# EAGLE design fuente_buck_50v-12v_10A_v1 (EAGLE 7.6.0)
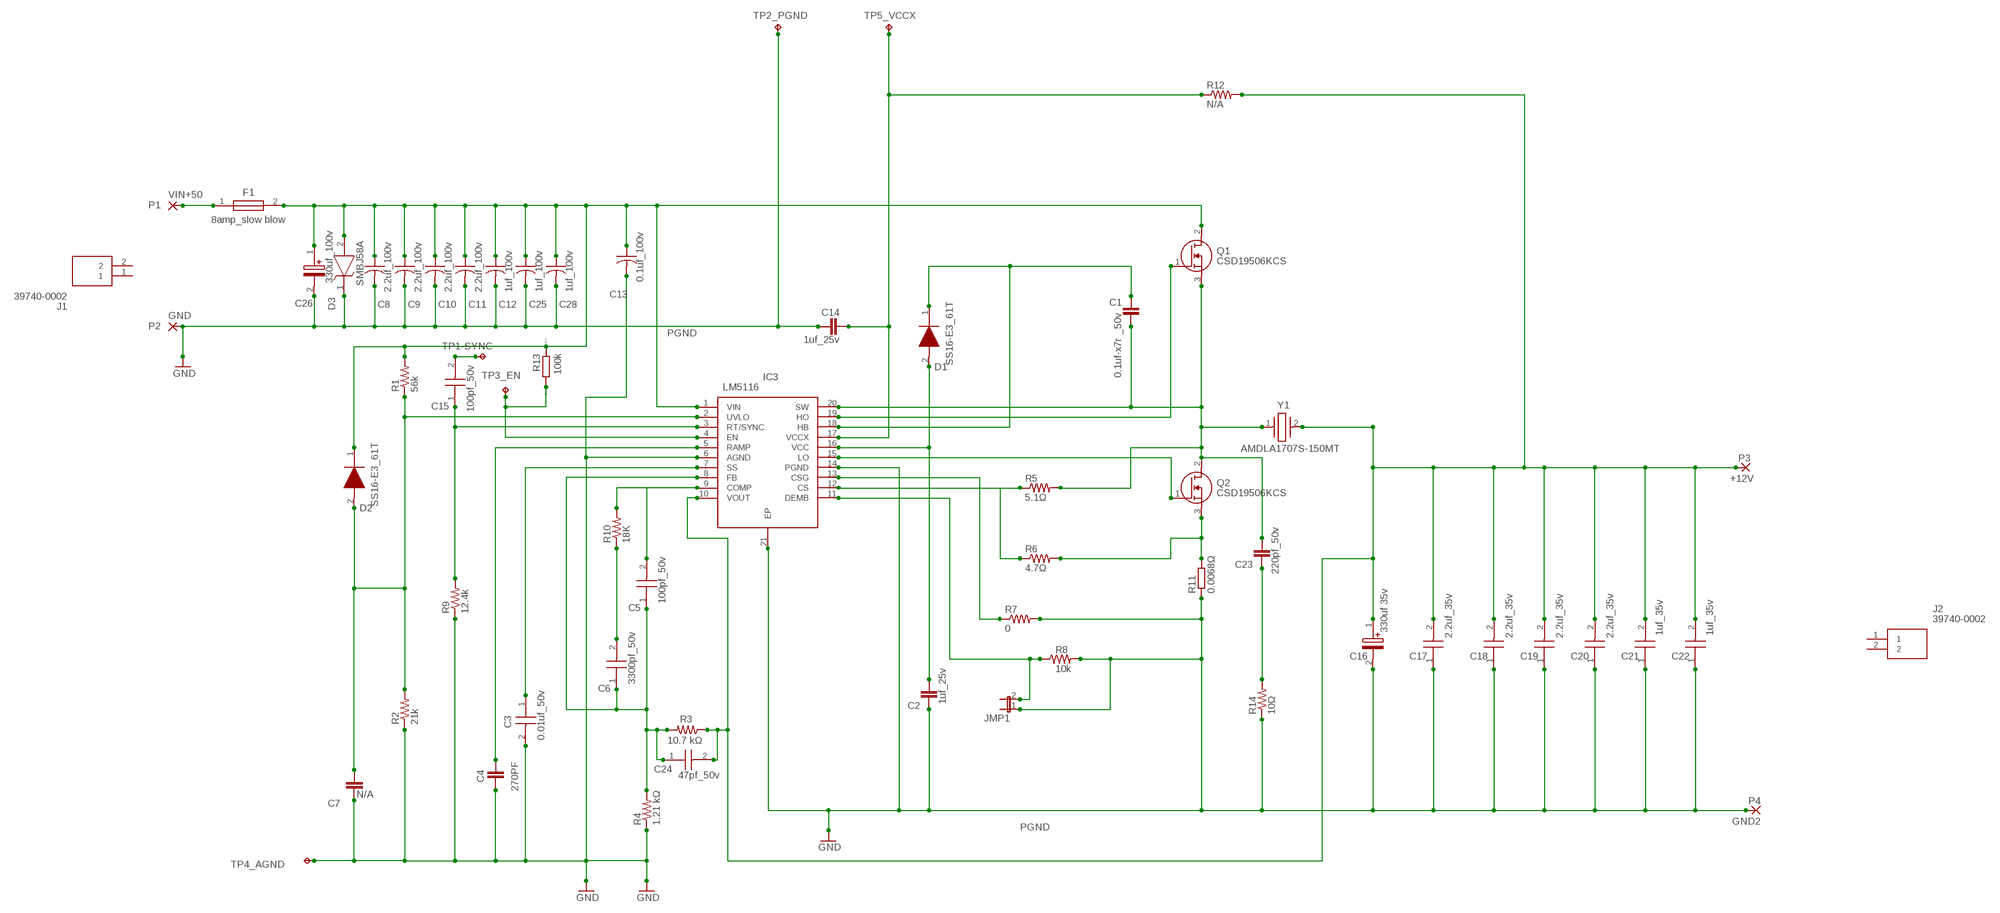
[diagram p0: schematic, sheet 1]

## Parts
+12V  P3  2,54/1,1  [2,54/1,1]
C1  0.1uf-x7r _50v  C-EUC0805  [C0805]
C2  1uf_25v  C-EUC0805  [C0805]
C3  0.01uf_50v  CGA3E2C0G1H221J080AD  [CAPC1608X90N]
C4  270PF  C-EUC0805  [C0805]
C5  100pf_50v  CGA3E2C0G1H221J080AD  [CAPC1608X90N]
C6  3300pf_50v  CGA3E2C0G1H221J080AD  [CAPC1608X90N]
C7  N/A  C-EUC0805  [C0805]
C8  2.2uf_100v  C-USC1206  [C1206]
C9  2.2uf_100v  C-USC1206  [C1206]
C10  2.2uf_100v  C-USC1206  [C1206]
C11  2.2uf_100v  C-USC1206  [C1206]
C12  1uf_100v  C-USC1206  [C1206]
C13  0.1uf_100v  C-USC1206  [C1206]
C14  1uf_25v  C-EUC0805  [C0805]
C15  100pf_50v  CGA3E2C0G1H221J080AD  [CAPC1608X90N]
C16  330uf 35v  EEEFK1V331P  [EEE0JA152UAP]
C17  2.2uf_35v  CL31B225KAHNNNE  [CAPC3216X180N]
C18  2.2uf_35v  CL31B225KAHNNNE  [CAPC3216X180N]
C19  2.2uf_35v  CL31B225KAHNNNE  [CAPC3216X180N]
C20  2.2uf_35v  CL31B225KAHNNNE  [CAPC3216X180N]
C21  1uf_35v  CL31B225KAHNNNE  [CAPC3216X180N]
C22  1uf_35v  CL31B225KAHNNNE  [CAPC3216X180N]
C23  220pf_50v  C-EUC0805  [C0805]
C24  47pf_50v  CGA3E2C0G1H221J080AD  [CAPC1608X90N]
C25  1uf_100v  C-USC1206  [C1206]
C26  330uf_100v  UCD2A331MNQ1MS  [CAPAE1910X1750N]
C28  1uf_100v  C-USC1206  [C1206]
D1  SS16-E3_61T  [DIOM5127X229N]
D2  SS16-E3_61T  [DIOM5127X229N]
D3  SMBJ58A  [DIOM5436X261N]
F1  8amp_slow blow  SF-1206S800W-2  [FUSC3216X123N]
GND  P2  2,54/1,1  [2,54/1,1]
GND2  P4  2,54/1,1  [2,54/1,1]
IC3  LM5116  LM5116MHX_NOPB  [SOP65P640X110-21N]
J1  39740-0002  [397400002]
J2  39740-0002  [397400002]
JMP1  JP1E  [JP1]
Q1  CSD19506KCS  [TO254P470X1016X1611-3P]
Q2  CSD19506KCS  [TO254P470X1016X1611-3P]
R1  56k  R-US_M0805  [M0805]
R2  21k  R-US_M0805  [M0805]
R3  10.7 kΩ  R-US_M0805  [M0805]
R4  1.21 kΩ  R-US_M0805  [M0805]
R5  5.1Ω  R-US_M0805  [M0805]
R6  4.7Ω  R-US_M0805  [M0805]
R7  0  R-US_M0805  [M0805]
R8  10k  R-US_M0805  [M0805]
R9  12.4k  R-US_M0805  [M0805]
R10  18K  R-US_M0805  [M0805]
R11  0.0068Ω  R-EU_R2512  [R2512]
R12  N/A  R-US_M0805  [M0805]
R13  100k  R  [R0805]
R14  10Ω  R-US_M0805  [M0805]
TP1-SYNC  TP1  TPPAD1-13  [P1-13]
TP2_PGND  TPPAD1-13  [P1-13]
TP3_EN  TPPAD1-13  [P1-13]
TP4_AGND  TPPAD1-13  [P1-13]
TP5_VCCX  TPPAD1-13  [P1-13]
VIN+50  P1  2,54/1,1  [2,54/1,1]
Y1  AMDLA1707S-150MT  [INDPM178169X700N]

## Nets
10K [power]: C2.1 D1.2(A) IC3.16(VCC)
GND [power]: C2.2 C3.2 C4.2 C7.2 C8.2 C9.2 C10.2 C11.2 C12.2 C13.2 C14.1 C16.2(-) C17.1 C18.1 C19.1 C20.1 C21.1 C22.1 C25.2 C26.2(-) C28.2 D3.1(K) GND2.1(P) GND.1(P) IC3.6(AGND) IC3.14(PGND) IC3.21(EP) JMP1.1 R2.1 R4.1 R7.2 R8.2 R9.1 R11.1 R14.1 TP2_PGND.TP TP4_AGND.TP
N$1: C5.1 C6.1 C24.1 IC3.8(FB) R3.2 R4.2
N$2: F1.1 VIN+50.1(P)
N$3: C23.2 R14.2
N$4: C7.1 D2.2(A) IC3.2(UVLO) R1.1 R2.2
N$5: C15.1 IC3.3(RT/SYNC) R9.2
N$6: C15.2 TP1-SYNC.TP
N$7: C4.1 IC3.5(RAMP)
N$8: C3.1 IC3.7(SS)
N$9: C14.2 IC3.17(VCCX) R12.1 TP5_VCCX.TP
N$10: C5.2 IC3.9(COMP) R10.2
N$11: IC3.19(HO) Q1.1(G)
N$12: C6.2 R10.1
N$14: +12V.1(P) C16.1(+) C17.2 C18.2 C19.2 C20.2 C21.2 C22.2 C24.2 IC3.10(VOUT) R3.1 R12.2 Y1.2
N$16: IC3.4(EN) R13.1 TP3_EN.TP
N$17: C1.1 C23.1 IC3.20(SW) Q1.3(S) Q2.2(D) R5.2 Y1.1
N$18: IC3.15(LO) Q2.1(G)
N$19: C1.2 D1.1(K) IC3.18(HB)
N$20: IC3.13(CSG) R7.1
N$21: Q2.3(S) R6.2 R11.2
N$23: IC3.11(DEMB) JMP1.2 R8.1
N$24: IC3.12(CS) R5.1 R6.1
VIN: C8.1 C9.1 C10.1 C11.1 C12.1 C13.1 C25.1 C26.1(+) C28.1 D2.1(K) D3.2(A) F1.2 IC3.1(VIN) Q1.2(D) R1.2 R13.2
Unconnected: J1.1 J1.2 J2.1 J2.2

## Notes on the sheet
- PGND
- PGND

## Library data of the parts
+12V GND GND2 VIN+50 = wirepad:2,54/1,1: THROUGH-HOLE PAD
C1 C2 C4 C7 C14 C23 = rcl:C-EU: CAPACITOR, European symbol
C3 C5 C6 C15 C24 = CGA3E2C0G1H221J080AD:CGA3E2C0G1H221J080AD: Multilayer Ceramic Capacitors MLCC - SMD/SMT EPXY 0603 50V, AEC-Q200, 220pF Source: Datasheet; DESCRIPTION: Multilayer Ceramic Capacitors MLCC - SMD/SMT EPXY 0603 50V, AEC-Q200, 220pF; HEIGHT: 0.9mm; MANUFACTURER_NAME: TDK; MANUFACTURER_PART_NUMBER: CGA3E2C0G1H221J080AD; MOUSER_PART_NUMBER: 810-CGA3E2C0G1H221JD; MOUSER_PRICE-STOCK: https://www.mouser.co.uk/ProductDetail/TDK/CGA3E2C0G1H221J080AD?qs=xLDY6iXSiQauXd%252Brvgz98g%3D%3D
C8-C13 C25 C28 = rcl:C-US: CAPACITOR, American symbol
C16 = EEEFK1V331P:EEEFK1V331P: SMD Aluminium Electrolytic Capacitor,Radial Can - SMD, 330 F, 35 V, FK Series, 2000 hours @ 105C Source: Datasheet <http://industrial.panasonic.com/cdbs/www-data/pdf/RDE0000/ABA0000C1181.pdf>; DESCRIPTION: SMD Aluminium Electrolytic Capacitor,Radial Can - SMD, 330 F, 35 V, FK Series, 2000 hours @ 105C; HEIGHT: 12mm; MANUFACTURER_NAME: Panasonic; MANUFACTURER_PART_NUMBER: EEEFK1V331P
C17-C22 = CL31B225KAHNNNE:CL31B225KAHNNNE: Samsung Electro-Mechanics 1206 CL 2.2uF Ceramic Multilayer Capacitor, 25 V, +125C, X7R Dielectric, +/-10% SMD Source: Datasheet <https://www.mouser.in/datasheet/2/585/MLCC-1837944.pdf>; DESCRIPTION: Samsung Electro-Mechanics 1206 CL 2.2uF Ceramic Multilayer Capacitor, 25 V, +125C, X7R Dielectric, +/-10% SMD; HEIGHT: 1.8mm; MANUFACTURER_NAME: SAMSUNG; MANUFACTURER_PART_NUMBER: CL31B225KAHNNNE
C26 = UCD2A331MNQ1MS:UCD2A331MNQ1MS: Nichicon 330F 100V dc Aluminium Electrolytic Capacitor, Surface Mount 18 (Dia.) x 16.5mm +105C 18mm Source: Datasheet <http://nichicon-us.com/english/products/pdfs/e-ucd.pdf>; DESCRIPTION: Nichicon 330F 100V dc Aluminium Electrolytic Capacitor, Surface Mount 18 (Dia.) x 16.5mm +105C 18mm; HEIGHT: 17.5mm; MANUFACTURER_NAME: Nichicon; MANUFACTURER_PART_NUMBER: UCD2A331MNQ1MS
D1 D2 = SS16-E3_61T:SS16-E3_61T: Vishay SS16-E3/61T, SMT Schottky Diode, 60V 1A, 2-Pin DO-214AC Source: Datasheet <https://componentsearchengine.com/Datasheets/2/SS16-E3_61T.pdf>; DESCRIPTION: Vishay SS16-E3/61T, SMT Schottky Diode, 60V 1A, 2-Pin DO-214AC; HEIGHT: 2.29mm; MANUFACTURER_NAME: Vishay; MANUFACTURER_PART_NUMBER: SS16-E3/61T; MOUSER_PART_NUMBER: 625-SS16-E3; MOUSER_PRICE-STOCK: https://www.mouser.co.uk/ProductDetail/Vishay-General-Semiconductor/SS16-E3-61T?qs=x2jpVgRnAtMiLlJLdPGu3w%3D%3D
D3 = SMBJ58A:SMBJ58A: Littelfuse SMBJ58A, Uni-Directional TVS Diode, 600W, 2-Pin DO-214AA Source: Datasheet <https://m.littelfuse.com/~/media/electronics/datasheets/tvs_diodes/littelfuse_tvs_diode_smbj_datasheet.pdf.pdf>; DESCRIPTION: Littelfuse SMBJ58A, Uni-Directional TVS Diode, 600W, 2-Pin DO-214AA; HEIGHT: 2.61mm; MANUFACTURER_NAME: LITTELFUSE; MANUFACTURER_PART_NUMBER: SMBJ58A
F1 = SF-1206S800W-2:SF-1206S800W-2: Surface Mount Fuses 8.0A Slow Blow 1206 SinglFuse Source: Datasheet <https://componentsearchengine.com/Datasheets/2/SF-1206S800W-2.pdf>; DESCRIPTION: Surface Mount Fuses 8.0A Slow Blow 1206 SinglFuse; HEIGHT: 1.23mm; MANUFACTURER_NAME: Bourns; MANUFACTURER_PART_NUMBER: SF-1206S800W-2; MOUSER_PART_NUMBER: 652-SF-1206S800W-2; MOUSER_PRICE-STOCK: https://www.mouser.co.uk/ProductDetail/Bourns/SF-1206S800W-2/?qs=fAHHVMwC%252BbhqdiwPMKxViA%3D%3D
IC3 = LM5116MHX_NOPB:LM5116MHX_NOPB: 6-100V Wide Vin, Current Mode Synchronous Buck Controller Source: Datasheet <http://www.ti.com/lit/gpn/lm5116>; DESCRIPTION: 6-100V Wide Vin, Current Mode Synchronous Buck Controller; HEIGHT: 1.1mm; MANUFACTURER_NAME: Texas Instruments; MANUFACTURER_PART_NUMBER: LM5116MHX/NOPB; MOUSER_PART_NUMBER: 926-LM5116MHX/NOPB; MOUSER_PRICE-STOCK: https://www.mouser.co.uk/ProductDetail/Texas-Instruments/LM5116MHX-NOPB?qs=QbsRYf82W3EaCl%2FW15P7yA%3D%3D
J1 J2 = 39740-0002:39740-0002: Pluggable Terminal Blocks EURO TERM BLK VERT 3.81MM 2C-GREEN Source: Datasheet <https://tools.molex.com/pdm_docs/sd/397400002_sd.pdf>; DESCRIPTION: Pluggable Terminal Blocks EURO TERM BLK VERT 3.81MM 2C-GREEN; HEIGHT: 8.9mm; MANUFACTURER_NAME: Molex; MANUFACTURER_PART_NUMBER: 39740-0002; MOUSER_PART_NUMBER: 538-39740-0002; MOUSER_PRICE-STOCK: https://www.mouser.co.uk/ProductDetail/Molex/39740-0002?qs=PVVDbbWpW3JCaIt2SPtzGA%3D%3D
JMP1 = jumper:JP1E: JUMPER
Q1 Q2 = CSD19506KCS:CSD19506KCS: Texas Instruments CSD19506KCS N-channel MOSFET Transistor, 273 A, 80 V, 3-Pin TO-220 Source: Datasheet <http://www.ti.com/lit/gpn/csd19506kcs>; DESCRIPTION: Texas Instruments CSD19506KCS N-channel MOSFET Transistor, 273 A, 80 V, 3-Pin TO-220; HEIGHT: 4.7mm; MANUFACTURER_NAME: Texas Instruments; MANUFACTURER_PART_NUMBER: CSD19506KCS; MOUSER_PART_NUMBER: 595-CSD19506KCS; MOUSER_PRICE-STOCK: https://www.mouser.co.uk/ProductDetail/Texas-Instruments/CSD19506KCS?qs=8sOby8ZxZLGQrkLPFGWmvQ%3D%3D
R1-R10 R12 R14 = rcl:R-US_: RESISTOR, American symbol
R11 = resistor:R-EU_: RESISTOR, European symbol
R13 = eagle-ltspice:R: RESISTOR, European symbol; SPICEMODEL: NONE; SPICEPREFIX: R
TP1-SYNC TP2_PGND TP3_EN TP4_AGND TP5_VCCX = testpad:TP: Test pad
Y1 = AMDLA1707S-150MT:AMDLA1707S-150MT: 15 H Shielded Molded Inductor 16 A 15.5mOhm Max Nonstandard - Source: Datasheet <https://abracon.com/datasheets/AMDLA1707S.pdf>; DESCRIPTION: 15 H Shielded Molded Inductor 16 A 15.5mOhm Max Nonstandard -; HEIGHT: 7mm; MANUFACTURER_NAME: ABRACON; MANUFACTURER_PART_NUMBER: AMDLA1707S-150MT; MOUSER_PART_NUMBER: 815-AMDLA1707S-150MT; MOUSER_PRICE-STOCK: https://www.mouser.co.uk/ProductDetail/ABRACON/AMDLA1707S-150MT?qs=DPoM0jnrROXZdMVrsDE%2FmQ%3D%3D

## Net classes
0 default: width 0.152 mm, drill 0.305 mm, clearance 0.152 mm
1 power: width 0.127 mm, drill 0.305 mm, clearance 0.127 mm
2 thin: width 0.508 mm, drill 0.305 mm, clearance 0.152 mm

## Board
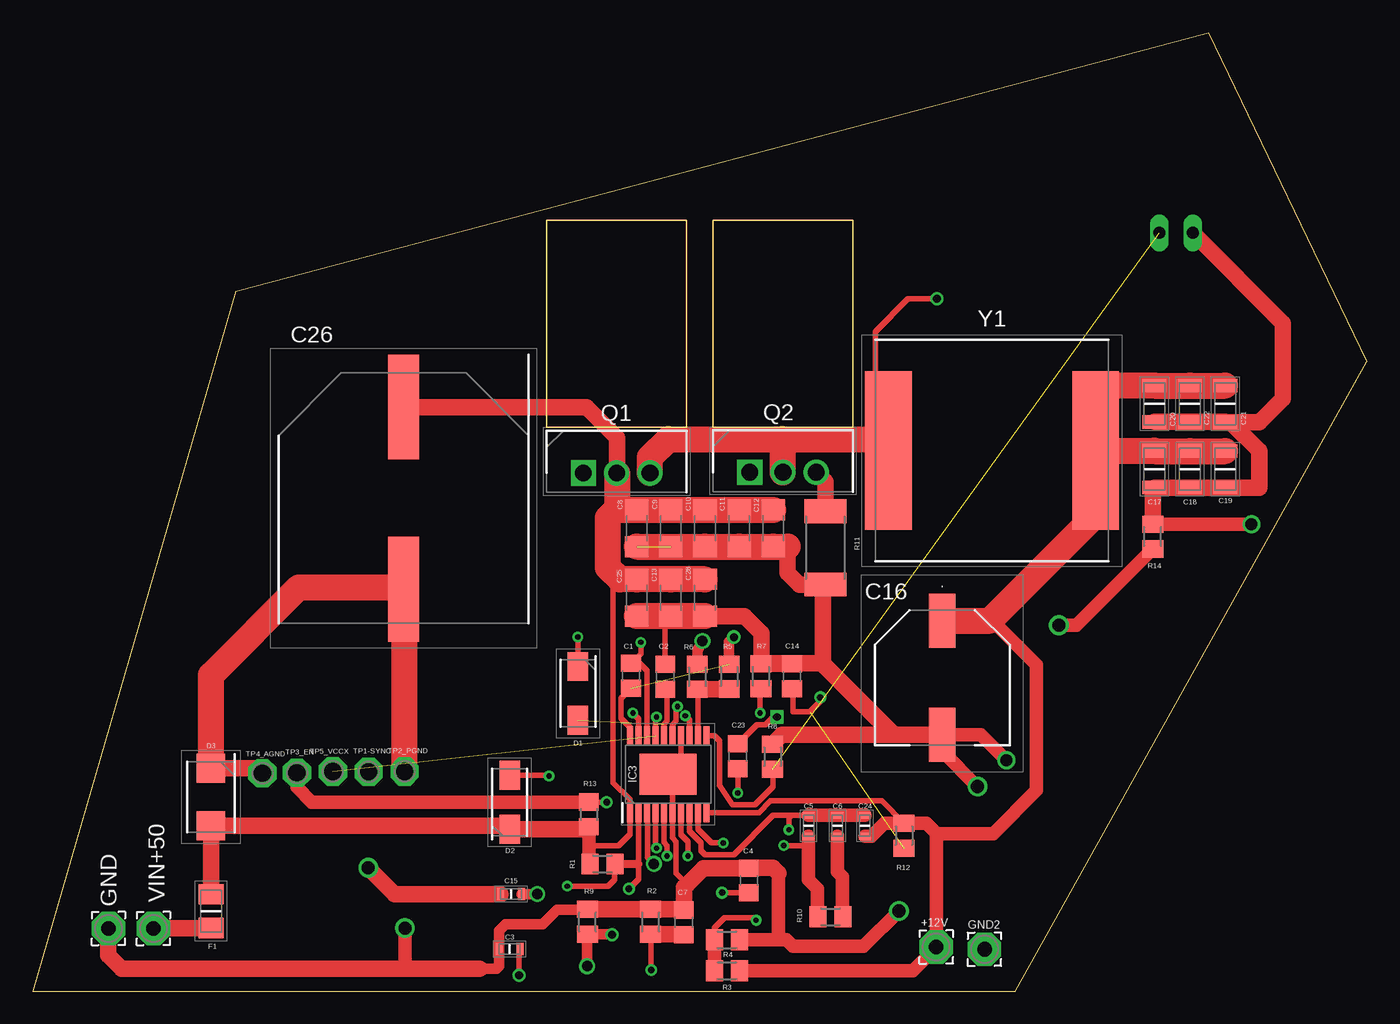
[diagram p1: board, top side]
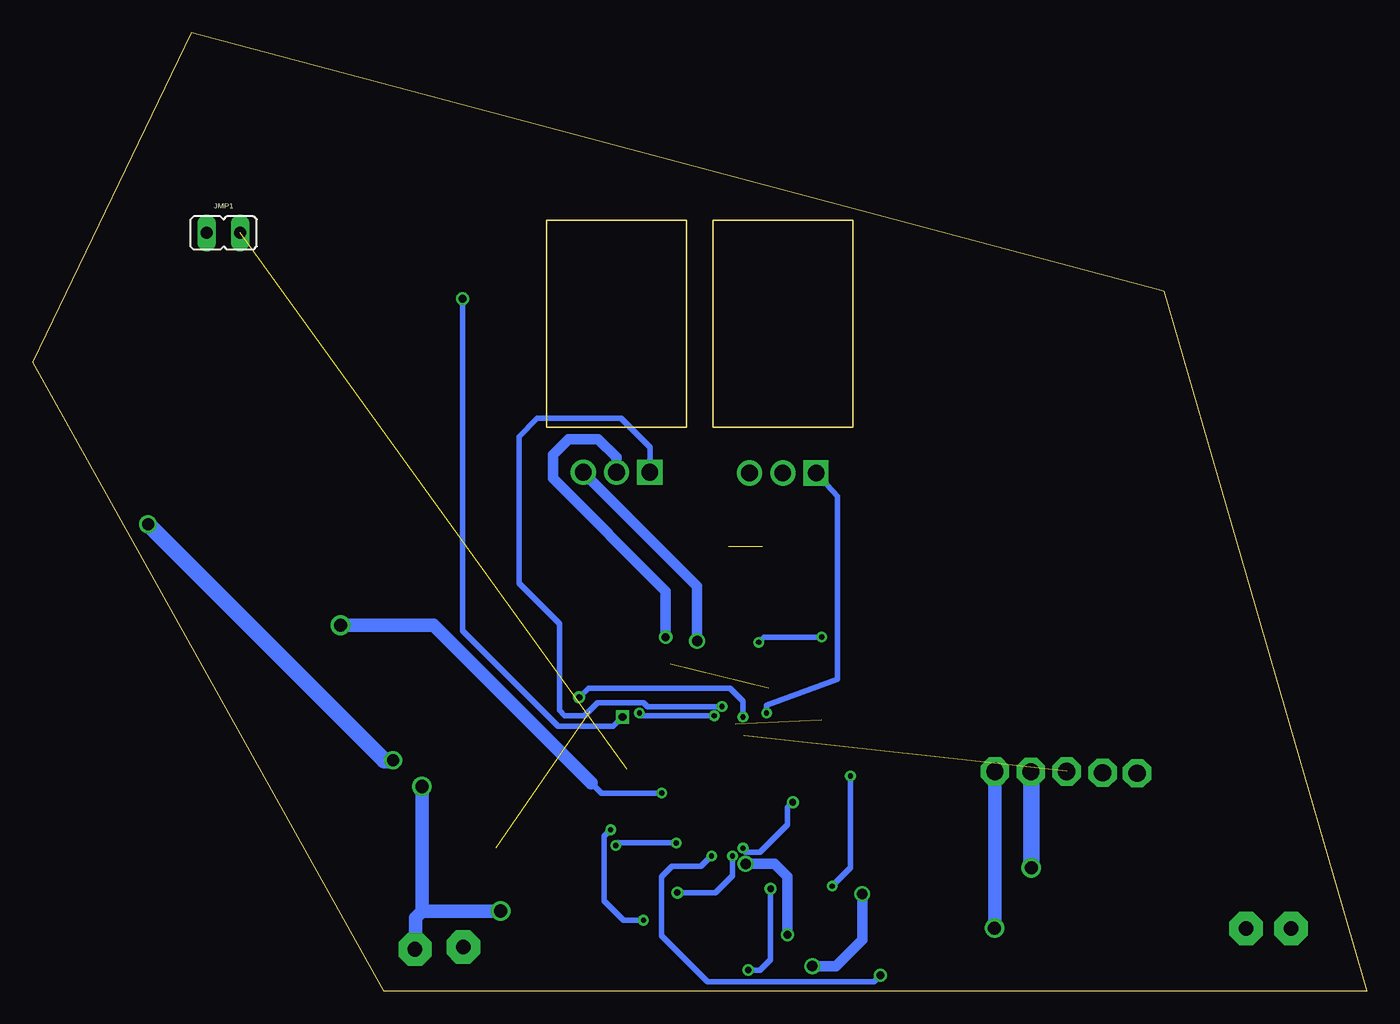
[diagram p2: board, bottom side, seen from below]

Size 101.8 x 73.1 mm. Coordinates in mm from the lower left corner, seen from the top.
Outline: 0,0 75,0 101.8,48 89.7,73.1 15.5,53.4 0,0
Outline: 39.2,43 39.2,58.8 49.9,58.8 49.9,43 39.2,43
Outline: 51.9,58.8 51.9,43 62.6,43 62.6,58.8 51.9,58.8
Copper layers (1*16): Top 0.035mm / dielectric 1.5mm / Bottom 0.035mm
Design rules "default": minimum track width 10mil, minimum drill 24mil, track to track 8mil, track to pad 8mil, pad to pad 8mil, via to via 8mil, smd to smd 8mil, copper to edge 40mil, drill to drill 8mil, minimum pad ring 10mil, minimum via ring 8mil, stop-mask expansion 4mil, vias tented up to drill 0mil, thermal gap 10mil

### Footprints (pad centres in the part's own frame; a part is rotated, then mirrored left to right if it is on the bottom)
2,54/1,1 = drill 1.118 pad 2.54 octagon: 1 0,0
C0805 = smd 1.3 x 1.5: 1 -0.95,0; 2 0.95,0
CAPC1608X90N = smd 0.54 x 0.94: 1 -0.8,0; 2 0.8,0
C1206 = smd 1.6 x 1.8: 1 -1.4,0; 2 1.4,0
EEE0JA152UAP = smd 4.1 x 2: 1 -4.35,0; 2 4.35,0
CAPC3216X180N = smd 1.05 x 1.82: 1 -1.39,0; 2 1.39,0
CAPAE1910X1750N = smd 8 x 2.4: 1 -6.95,0; 2 6.95,0
DIOM5127X229N = smd 2.2 x 1.55: 1 -2.05,0; 2 2.05,0
DIOM5436X261N = smd 2.2 x 2.15: 1 -2.2,0; 2 2.2,0
FUSC3216X123N = smd 1.55 x 1.91: 1 -1.285,0; 2 1.285,0
SOP65P640X110-21N = smd 1.45 x 0.45: 1 -2.925,2.925; 2 -2.925,2.275; 3 -2.925,1.625; 4 -2.925,0.975; 5 -2.925,0.325; 6 -2.925,-0.325; 7 -2.925,-0.975; 8 -2.925,-1.625; 9 -2.925,-2.275; 10 -2.925,-2.925; 11 2.925,-2.925; 12 2.925,-2.275; 13 2.925,-1.625; 14 2.925,-0.975; 15 2.925,-0.325; 16 2.925,0.325; 17 2.925,0.975; 18 2.925,1.625; 19 2.925,2.275; 20 2.925,2.925 | smd 3.15 x 4.35: 21 0,0
397400002 = drill 1.2 pad 1.8 square: 1 0,0 | drill 1.2 pad 1.8: 2 3.81,0
JP1 = drill 0.914 long: 1 0,-1.27; 2 0,1.27
TO254P470X1016X1611-3P = drill 1.28 pad 1.92 square: 1 0,0 | drill 1.28 pad 1.92: 2 2.54,0; 3 5.08,0
M0805 = smd 1.3 x 1.6: 1 -0.95,0; 2 0.95,0
R2512 = smd 1.8 x 3.2: 1 -2.8,0; 2 2.8,0
R0805 = smd 1.3 x 1.5: 1 -0.95,0; 2 0.95,0
P1-13 = drill 1.321 pad 2.159 octagon: TP 0,0
INDPM178169X700N = smd 3.55 x 12.1: 1 -7.9,0; 2 7.9,0

### Placement (x,y rotation side)
+12V  68.95,3.35 0 top
C1  45.66,24.05 90 top
C2  48.26,23.98 90 top
C3  36.4,3.2 180 top
C4  54.65,8.43 90 top
C5  59.2,12.6 270 top
C6  61.4,12.6 270 top
C7  49.69,5.23 90 top
C8  46.1,35.3 270 top
C9  48.7,35.3 270 top
C10  51.3,35.3 270 top
C11  53.9,35.3 270 top
C12  56.5,35.3 270 top
C13  48.7,30 270 top
C14  57.94,24.01 270 top
C15  36.5,7.4 180 top
C16  69.4,23.9 270 top
C17  85.6,39.8 90 top
C18  88.3,39.8 90 top
C19  91,39.8 90 top
C20  85.6,44.8 90 top
C21  88.3,44.8 90 top
C22  91,44.8 90 top
C23  53.8,17.9 270 top
C24  63.5,12.6 270 top
C25  46.1,30 270 top
C26  28.3,37.6 270 top
C28  51.3,30 270 top
D1  41.6,22.7 270 top
D2  36.4,14.4 90 top
D3  13.6,14.8 270 top
F1  13.6,6.1 90 top
GND  5.77,4.77 270 top
GND2  72.63,3.19 0 top
IC3  48.49,16.54 90 top
J1  -11.5,-21.7 180 top  (outside the outline)
J2  -2.3,-21.7 0 top  (outside the outline)
JMP1  87.24,57.83 270 bottom
Q1  42.02,39.52 0 top
Q2  54.71,39.57 0 top
R1  43.47,9.69 180 top
R2  47.16,5.27 270 top
R3  52.97,1.55 180 top
R4  52.97,3.9 180 top
R5  53.15,23.99 90 top
R6  50.71,23.98 90 top
R7  55.56,24.01 90 top
R8  56.46,17.87 90 top
R9  42.33,5.27 270 top
R10  60.87,5.65 180 top
R11  60.5,33.8 90 top
R12  66.49,11.85 90 top
R13  42.44,13.47 270 top
R14  85.46,34.67 270 top
TP1-SYNC  25.63,16.73 0 top
TP2_PGND  28.38,16.75 0 top
TP3_EN  20.16,16.65 0 top
TP4_AGND  17.53,16.61 0 top
TP5_VCCX  22.9,16.75 0 top
VIN+50  9.21,4.77 0 top
Y1  73.2,41.22 0 top

### Tracks (layer width: path | path; a pad name or v marks a point on that pad's centre or on a via)
10K  (1 unrouted)
  Top 0.406: IC3.16 48.16,20.36 48.4,20.6 48.4,22.89 C2.1
GND  (via drill 0.9, 1)  (1 unrouted)
  Top 0.406: IC3.14 49.47,17.52 IC3.21 48.81,16.21 IC3.6 48.81,11.69 49.1,11.4 49.1,9 49.95,8.15 | C2.2 48.26,28.6 C13.2 | C28.2 51.8,28.6
  Top 0.813: 34.1,1.7 35.4,1.7 35.6,1.9 C3.2 35.6,4.6 36.1,5.1 38.9,5.1 40,6.2 42.31,6.2
  Top 1.016: R4.1 56.9,3.9 | 56.9,3.9 56.9,9 | 56.9,3.9 57.5,3.9 58,3.4 63.4,3.4 v66.1,6.1 | v28.4,4.8 28.4,1.7 | 42.31,6.2 R9.1 | v72.1,15.6 69.4,18.3 C16.2 72.35,19.55 v74.3,17.6 | v93,35.6 R14.1
  Top 1.27: GND.1 5.77,2.73 6.8,1.7 28.4,1.7 34.1,1.7 | C20.1 C21.1 C22.1 91.4,43.4 | 91.4,43.4 93.6,41.2 93.6,38.4 C19.1 C18.1 C17.1 85.46,38.27 R14.1 | R9.1 R2.1 49.65,6.22 C7.2 49.7,7.9 49.95,8.15 51.18,9.38 C4.2 54.67,9.4 56.5,9.4 56.9,9 | D3.1 17.14,17 TP4_AGND.TP | C16.2 65.75,19.55 60.3,25 55.6,25 | C14.1 R7.2 55.6,25 | C16.2 57.19,19.55 R8.2 | C16.2 65.65,19.55 60.3,24.9 60.3,30.8 R11.1 58.5,31 57.6,31.9 57.6,33.9 | 51.8,28.6 54.3,28.6 55.6,27.3 55.6,25 | JMP1.1 95.4,50.94 95.4,45.2 93.6,43.4 91.4,43.4
  Top 2: C28.2 C13.2 C25.2 | C8.2 C10.2 C11.2 C12.2 57.6,33.9 | TP2_PGND.TP 28.38,30.57 C26.2 28.15,30.8 20.3,30.8 13.6,24.1 D3.1
  Bottom 1.016: v66.1,6.1 72.1,6.1 | GND2.1 72.6,3.22 72.6,5.6 72.1,6.1 | TP2_PGND.TP 28.38,4.82 v28.4,4.8 | v72.1,15.6 72.1,6.1
  Bottom 1.27: v74.3,17.6 75,17.6 v93,35.6
N$1  (via drill 0.4)
  Top 0.406: IC3.8 50.12,12.19 51,11.3 51,10.7 51.3,10.4 53.5,10.4 56.5,13.4 57.9,13.4 | 57.9,13.4 C5.1 | R4.2 52.02,4.82 52.8,5.6 55,5.6 v55.2,5.4 | v57.7,12.3 57.7,13.2 57.9,13.4
  Top 1.016: R3.2 R4.2 | C24.1 C6.1 C5.1
  Bottom 0.406: v55.2,5.4 56.7,5.4 58.2,6.9 58.2,11.8 v57.7,12.3
N$2
  Top 1.27: VIN+50.1 13.55,4.77 F1.1
N$3  (via drill 0.4, 1)
  Top 0.406: v53.8,15.1 C23.2
  Top 1.016: R14.2 79.64,27.9 v78.3,27.9
  Bottom 0.406: 59.2,15.9 58.4,15.1 v53.8,15.1
  Bottom 1.016: v78.3,27.9 71.2,27.9 59.2,15.9
N$4  (via drill 0.4, 0.5)
  Top 0.406: 46.2,9.7 46.22,9.71 | 46.22,9.71 IC3.2 | 46.22,9.71 46.22,8.52 v45.5,7.8 | v47.2,1.6 47.2,4.28 R2.2 | D2.2 39.25,16.45 v39.4,16.4 | v40.8,8 43.9,8 44.4,8.5 44.4,9.67 R1.1
  Top 0.61: R1.1 46.19,9.69 46.2,9.7
  Top 1.27: R2.2 49.65,4.32 C7.1
  Bottom 0.406: v45.5,7.8 45.5,2.4 46.3,1.6 v47.2,1.6 | v39.4,16.4 39.4,9.4 v40.8,8
N$5  (via drill 0.6, 0.8)
  Top 0.406: IC3.3 46.9,13.58 46.9,10.2 v47.4,9.7
  Top 0.813: C15.1 v38.5,7.4 | v42.3,1.9 42.3,4.29 R9.2 44.18,4.32 v44.2,4.3
  Bottom 0.813: v38.5,7.4 38.5,3.9 40.5,1.9 v42.3,1.9 | v44.2,4.3 44.2,8.7 45.2,9.7 v47.4,9.7
N$6  (via drill 1)
  Top 1.27: C15.2 27.6,7.4 v25.6,9.4
  Bottom 1.27: v25.6,9.4 25.6,16.7 TP1-SYNC.TP
N$7  (via drill 0.4, 0.5)
  Top 0.406: v52.6,7.5 54.63,7.5 C4.1 | IC3.5 48.16,11.34 48.4,11.1 v48.4,10.3
  Bottom 0.406: v52.6,7.5 49.7,7.5 48.4,8.8 v48.4,10.3
N$8  (via drill 0.4, 0.6)
  Top 0.406: v37.1,1.2 37.1,3.1 C3.1 | IC3.7 49.47,11.94 50,11.4 v50,10.3
  Bottom 0.406: v37.1,1.2 37.6,0.7 50.3,0.7 53.8,4.2 53.8,8.7 53,9.5 50.8,9.5 v50,10.3
N$9  (via drill 0.4, 0.5)  (2 unrouted)
  Top 0.406: IC3.17 47.52,20.82 v47.6,20.9 | v60.1,22.4 60.1,22.1 59.3,21.3 58,21.3 58,23 C14.2
  Bottom 0.406: v47.6,20.9 47.6,22.1 48.6,23.1 59.4,23.1 v60.1,22.4
N$10  (via drill 0.4)
  Top 0.406: v57.3,11.1 59.1,11.1 59.2,11.2 | IC3.9 50.77,12.34 51.8,11.3 v52.7,11.3
  Top 1.016: C5.2 59.2,11.2 59.2,8.5 59.9,7.8 59.9,5.67 R10.2
  Bottom 0.406: v52.7,11.3 57.1,11.3 v57.3,11.1
N$11  (via drill 0.4)
  Top 0.406: IC3.19 46.22,20.79 v45.8,21.2
  Bottom 0.406: v45.8,21.2 45.8,21.8 40.4,23.8 40.4,37.74 Q1.1
N$12
  Top 1.016: C6.2 61.4,9.1 61.8,8.7 61.8,5.67 R10.1
N$14
  Top 0.406: IC3.10 55.41,13.62 56.3,14.5 64.79,14.5 R12.2
  Top 1.016: R3.1 67.15,1.55 +12V.1 68.95,12.05 | 68.95,12.05 68.2,12.8 R12.2 65,12.8 64,11.8 C24.2 | C16.1 73.25,28.25 76.6,24.9 76.6,15.3 73.3,12 69,12 68.95,12.05
  Top 2: Y1.2 85.57,41.22 C17.2 C18.2 C19.2 | Y1.2 81.1,45.4 81.89,46.19 C20.2 C21.2 C22.2 | C16.1 73.05,28.25 81.1,36.3 Y1.2
N$16  (via drill 0.4, 0.5)
  Top 0.406: v43.8,14.4 42.46,14.4 R13.1 | IC3.4 47.52,10.98 v47.6,10.9
  Top 1.016: TP3_EN.TP 20.16,15.54 21.3,14.4 42.42,14.4 R13.1
  Bottom 0.406: v43.8,14.4 44.2,14 44.2,12.7 46.3,10.6 47.4,10.6 47.6,10.8 v47.6,10.9
N$17  (via drill 0.6)  (1 unrouted)
  Top 0.406: IC3.20 45.56,20.14 44.9,20.8 44.9,22.34 C1.1 | C23.1 55.25,20.3 55.9,20.3 56.5,20.9 v56.8,20.9 | v69,52.8 66.8,52.8 64.3,50.3 64.3,42.22 64.42,42.1
  Top 0.813: R5.2 53.15,26.65 v53.5,27
  Top 1.27: 53.2,24.99 R5.2
  Top 2: Q1.3 47.1,40.7 48.5,42.1 57.2,42.1 | 57.2,42.1 64.42,42.1 Y1.1 | Q2.2 57.25,42.05 57.2,42.1
  Bottom 0.406: v56.8,20.9 57.5,20.2 61.7,20.2 69,27.5 v69,52.8
  Bottom 0.813: v53.5,27 53.5,30.5 62.1,39.1 62.1,40.9 60.9,42.1 58.65,42.1 57.25,40.7 Q2.2
N$18  (via drill 0.4)
  Top 0.406: IC3.15 48.81,20.32 49.1,20.6 49.1,21.6 v49.2,21.7
  Bottom 0.406: v49.2,21.7 54.9,21.7 55.2,22 58.7,22 59.7,21 61.2,21 61.6,21.4 61.6,28 64.7,31.1 64.7,42.3 63.3,43.7 56.9,43.7 54.7,41.5 Q2.1
N$19  (via drill 0.4)
  Top 0.406: IC3.18 46.87,24.43 46.3,25 C1.2 46.4,25.74 v46.4,26.6 | v41.6,27 D1.1
  Bottom 0.406: v46.4,26.6 46,27 v41.6,27
N$20  (via drill 0.4)
  Top 0.406: IC3.13 50.12,20.68 v49.8,21 | v55.5,21.2 55.5,23 R7.1
  Bottom 0.406: v49.8,21 55.3,21 v55.5,21.2
N$21  (via drill 0.8)
  Top 0.813: R6.2 50.71,26.01 v51.1,26.7
  Top 1.27: Q2.3 60.5,38.86 R11.2
  Bottom 0.813: v51.1,26.7 51.1,30.88 Q2.3
N$23  (1 unrouted)
  Top 0.406: IC3.11 52.03,19.46 52.4,19.1 52.4,15.7 53.4,14.2 55.1,14.2 56.5,15.6 56.5,16.88 R8.1
N$24
  Top 0.406: IC3.12 50.77,22.98 R6.1
  Top 1.27: R6.1 R5.1
VIN
  Top 0.406: 42.44,10.9 42.64,11.1 44.7,11.1 45.56,11.96 IC3.1 45.56,14.63 44.3,15.9 44.3,30.9 44.8,31.4
  Top 1.016: R13.2 42.44,10.9 42.44,9.77 R1.2
  Top 1.27: C26.1 42.25,44.55 44.6,42.2 44.6,39.56 Q1.2 | F1.2 D3.2 36.35,12.6 D2.1 42.27,12.35 R13.2 42.41,12.55
  Top 2: Q1.2 44.6,39.48 44.6,36.8 | 44.6,36.8 44.7,36.7 C8.1 C9.1 C10.1 C11.1 C12.1 | C25.1 C13.1 C28.1 44.8,31.4 43.9,32.3 43.9,36.1 44.6,36.8